# EAGLE design RAINMETER_V1 (EAGLE 9.6.2)
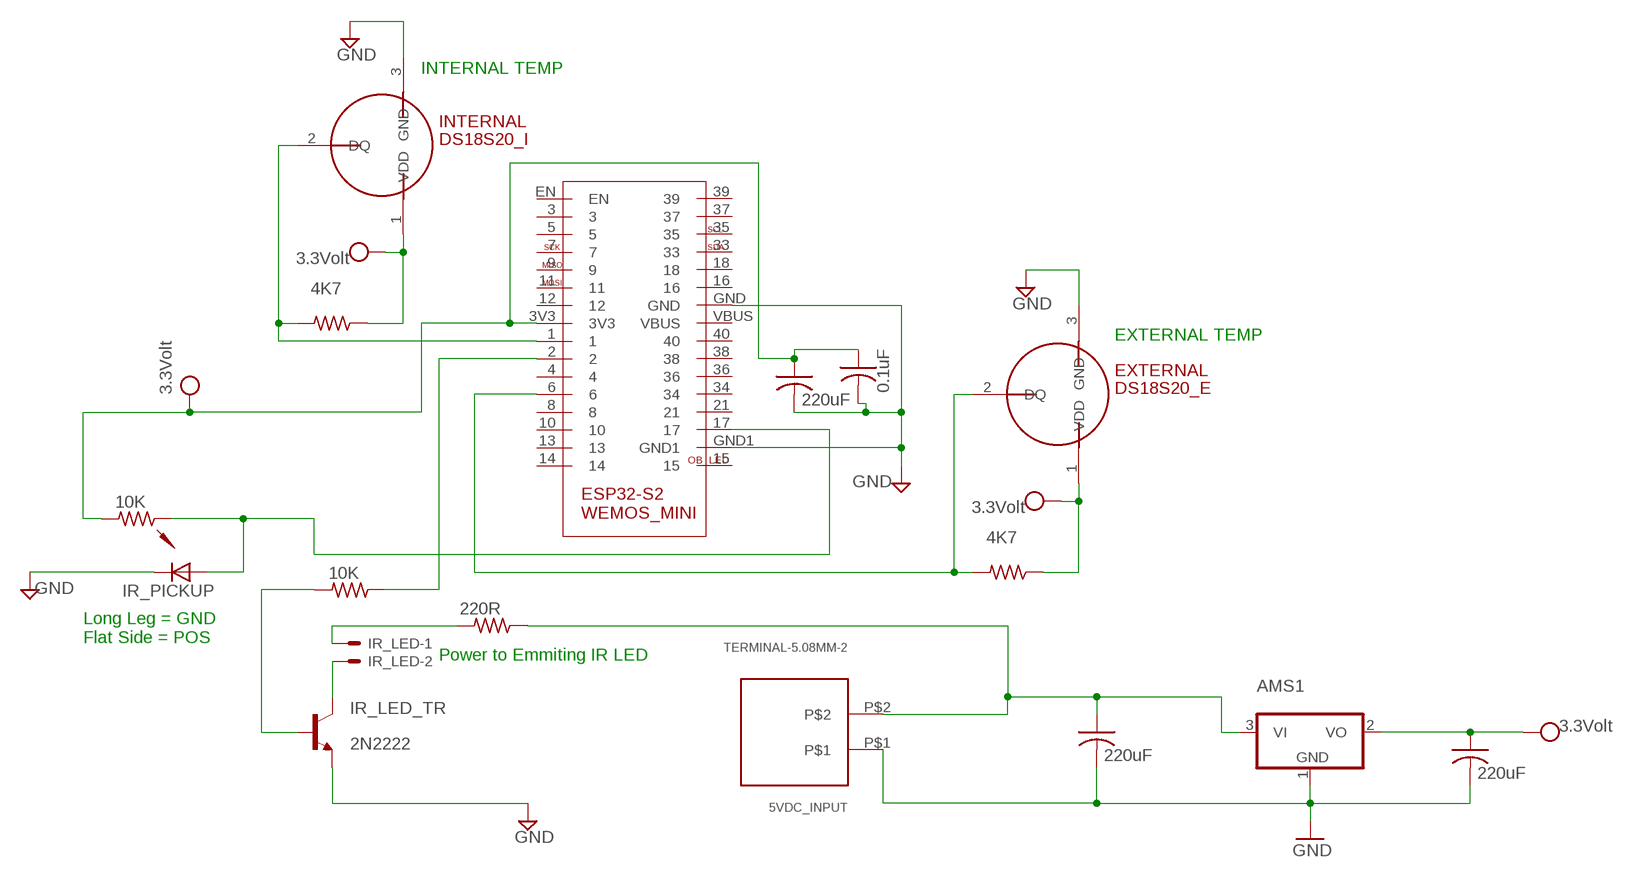
[diagram p0: schematic, sheet 1]

## Parts
5VDC_INPUT  TERMINAL-5.08MM-2  [TERM-5.05-2]
AMS1  AMS1117DB  [SOT223]
C1  220uF  CAP_3.5MMCAP2.5/5  [C3.5-5]
C2  220uF  CAP_3.5MMCAP2.5/5  [C3.5-5]
C5  0.1uF  C-US050-025X075  [C050-025X075]
C7  220uF  CAP_3.5MMCAP2.5/5  [C3.5-5]
DS18S20_E  EXTERNAL  DS1820  [TO92-LINE]
DS18S20_I  INTERNAL  DS1820  [TO92-LINE]
IR_LED  C-GRID-02-70553  [70553-02]
IR_LED_TR  2N2222  [TO92-EBC-OVAL]
IR_PICKUP  INFRARED_PICKUP5MM  [INFRARED_PICKUP]
R1  4K7  R-US_R0805  [R0805]
R2  10K  R-US_R0805  [R0805]
R3  4K7  R-US_R0805  [R0805]
R7  220R  R-US_R0805  [R0805]
R8  10K  R-US_R0805  [R0805]
U$2  WEMOS_S2_MINI  [WEMOS_S2_MINI]

## Nets
GND [GND]: 5VDC_INPUT.P$1 AMS1.1(GND) C1.2 C2.2 C5.2 C7.2 DS18S20_E.3(GND) DS18S20_I.3(GND) IR_LED_TR.E IR_PICKUP.K(C) U$2.GND U$2.GND1
N$1: DS18S20_I.2(DQ) R1.2 U$2.1
N$2: IR_LED.2 IR_LED_TR.C
N$3: DS18S20_E.2(DQ) R3.2 U$2.6
N$4 [GND]: IR_LED.1 R7.2
N$5: IR_LED_TR.B R2.2
N$6: R2.1 U$2.2
N$18: IR_PICKUP.A R8.1 U$2.17
N$21 [12V]: 5VDC_INPUT.P$2 AMS1.3(VI) C7.1 R7.1
VCC [3V]: AMS1.2(VO) C1.1 C2.1 C5.1 DS18S20_E.1(VDD) DS18S20_I.1(VDD) R1.1 R3.1 R8.2 U$2.3V3
Unconnected: U$2.3 U$2.4 U$2.5 U$2.7 U$2.8 U$2.9 U$2.10 U$2.11 U$2.12 U$2.13 U$2.14 U$2.15 U$2.16 U$2.18 U$2.21 U$2.33 U$2.34 U$2.35 U$2.36 U$2.37 U$2.38 U$2.39 U$2.40 U$2.EN U$2.VBUS

## Notes on the sheet
- INTERNAL TEMP
- EXTERNAL TEMP
- Long Leg = GND
  Flat Side = POS
- Power to Emmiting IR LED

## Library data of the parts
5VDC_INPUT = BDV_01:TERMINAL-5.08MM-2: Terminal 5.08mm - 2
AMS1 = BDV_01:AMS1117: 250 mA, 16V, Low Quiescent Current LDO Regulator Source: http://ww1.microchip.com/downloads/en/DeviceDoc/22049b.pdf
C1 C2 C7 = BDV_01:CAP_3.5MM: Cap 3.5 MM
C5 = adafruit:C-US: CAPACITOR, American symbol
DS18S20_E DS18S20_I = BDV_01:DS1820: DS1820 (Temperature Sensor)
IR_LED = con-molex:C-GRID-02: CONNECTOR wire to board 2.54 mm (0.100") pitch header; OC_FARNELL: unknown; OC_NEWARK: unknown
IR_LED_TR = adafruit:2N2222: NPN TRANSISTOR Big oval pads
IR_PICKUP = BDV_01:INFRARED_PICKUP: Infra Red LED Pickup
R1-R3 R7 R8 = resistor:R-US_: RESISTOR, American symbol
U$2 = BDV_02:WEMOS_S2_MINI: WEMOS_MINI

## Net classes
0 default: width 0.8 mm, drill 0.508 mm, clearance 0.6 mm
1 POWER: width 0.8 mm, drill 0.508 mm, clearance 0.6 mm
2 12V: width 0.8 mm, drill 0.508 mm, clearance 0.6 mm
3 5V: width 0.8 mm, drill 0.508 mm, clearance 0.6 mm
4 3V: width 0.8 mm, drill 0.508 mm, clearance 0.6 mm
5 GND: width 0.8 mm, drill 0.508 mm, clearance 0.6 mm

## Board
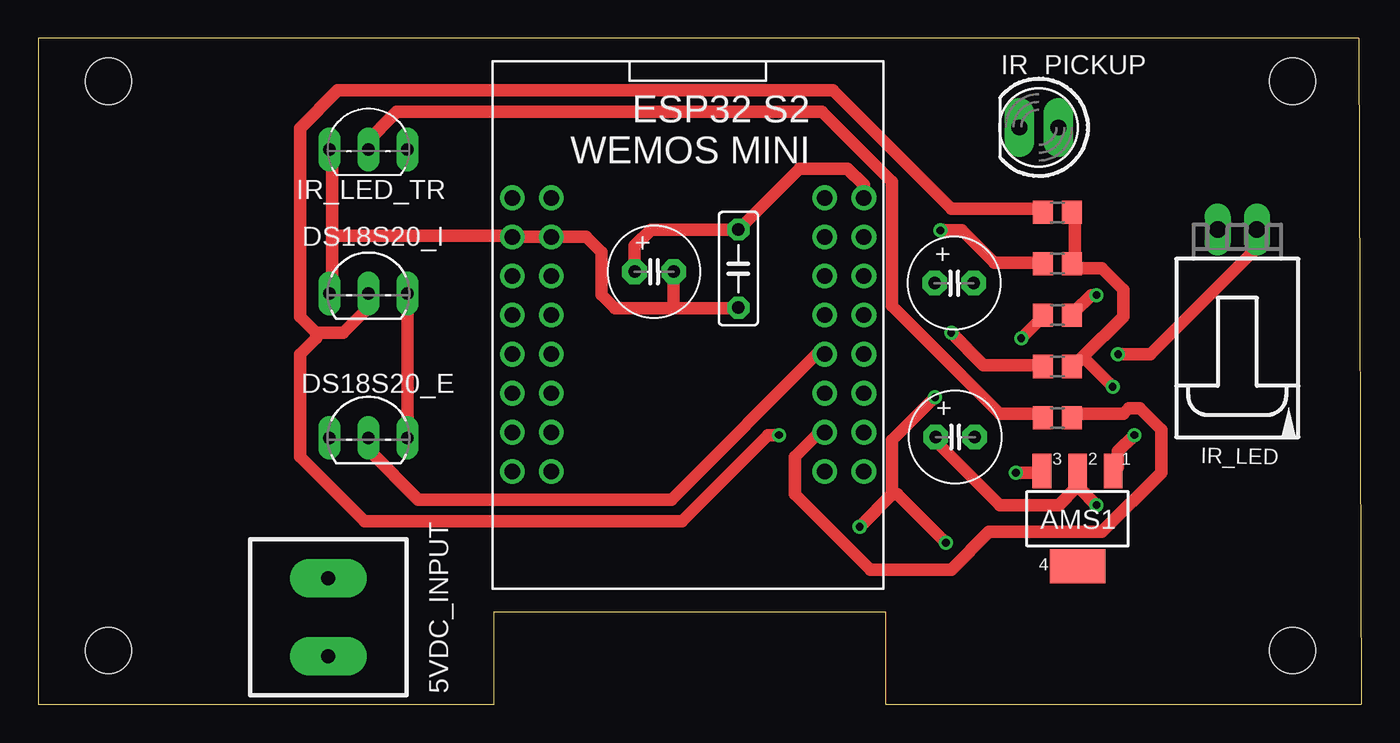
[diagram p1: board, top side]
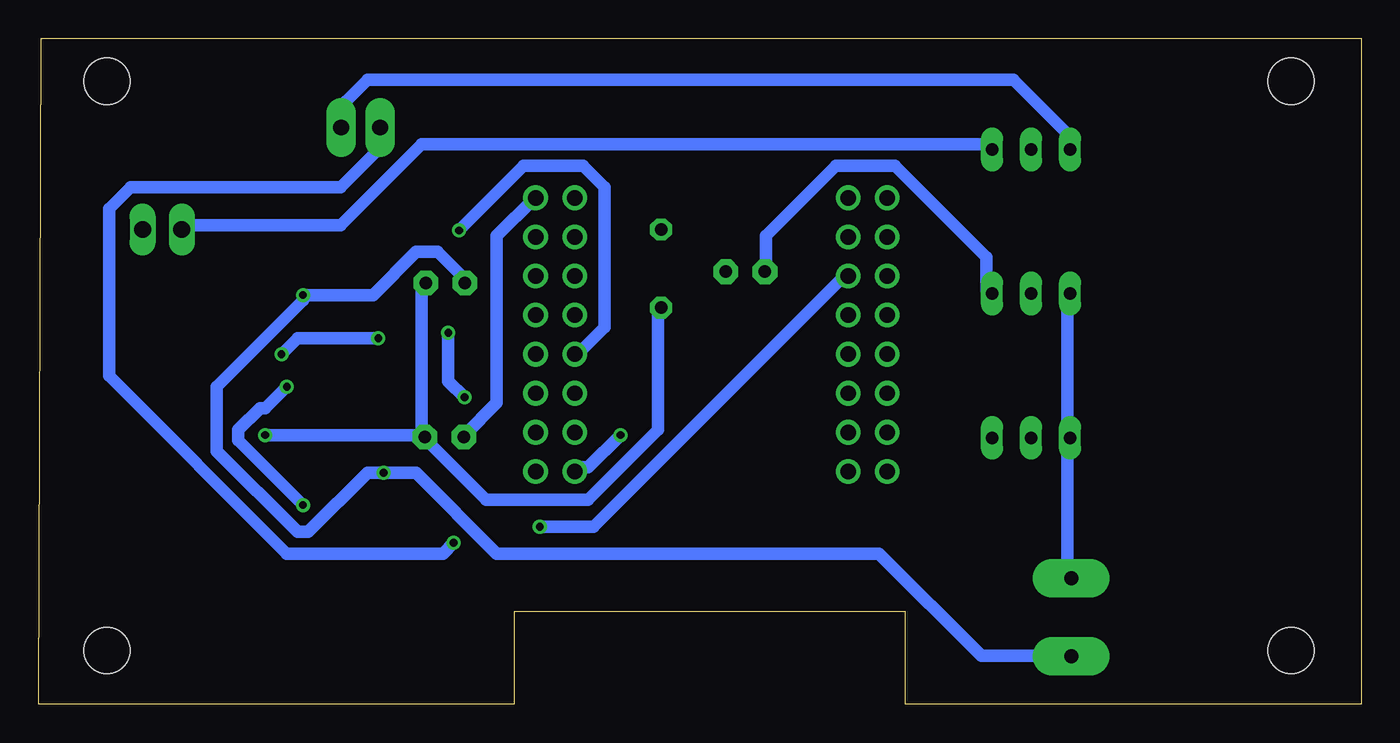
[diagram p2: board, bottom side, seen from below]

Size 86 x 43.28 mm. Coordinates in mm from the lower left corner, seen from the top.
Outline: 85.85,43.28 0,43.28 0,0 29.64,0 29.64,6 55.07,6 55.07,0 86,0 85.85,43.28
Copper layers (1*16): Top 0.035mm / dielectric 1.5mm / Bottom 0.035mm
Design rules "default_BDV_04 *": minimum track width 6mil, minimum drill 0.35mm, track to track 6mil, track to pad 6mil, pad to pad 6mil, via to via 6mil, smd to smd 6mil, copper to edge 40mil, drill to drill 6mil, minimum pad ring 12mil, minimum via ring 8mil, stop-mask expansion 4mil, vias tented up to drill 20mil, thermal gap 16mil
Holes 3 mm at 4.55,3.5 4.55,40.5 81.55,40.5 81.55,3.5

### Footprints (pad centres in the part's own frame; a part is rotated, then mirrored left to right if it is on the bottom)
TERM-5.05-2 = drill 0.9 pad 2.5 long: P$1 0,2.54; P$2 0,-2.54
SOT223 = smd 1.219 x 2.235: 1 -2.311,-3.099; 2 0,-3.099; 3 2.311,-3.099 | smd 3.6 x 2.2: 4 0,3.099
C3.5-5 = drill 0.813 pad 1.6 octagon: 1 -1.27,0; 2 1.27,0
C050-025X075 = drill 0.813 octagon: 1 -2.54,0; 2 2.54,0
TO92-LINE = drill 0.813 long: 1 2.54,0; 2 0,0; 3 -2.54,0
70553-02 = drill 1.092 long: 1 -1.27,-7.62; 2 1.27,-7.62
TO92-EBC-OVAL = drill 0.813 long: B 0,-1.27; C 2.54,-1.27; E -2.54,-1.27
INFRARED_PICKUP = drill 1.016 pad 1.93 long: A 1.27,0; K -1.27,0
R0805 = smd 1.3 x 1.5: 1 -0.95,0; 2 0.95,0
WEMOS_S2_MINI = drill 1: 1 -8.89,10.16; 2 -8.89,7.62; 3 -11.43,7.62; 3V3 -11.43,-7.62; 4 -8.89,5.08; 5 -11.43,5.08; 6 -8.89,2.54; 7 -11.43,2.54; 8 -8.89,0; 9 -11.43,0; 10 -8.89,-2.54; 11 -11.43,-2.54; 12 -11.43,-5.08; 13 -8.89,-5.08; 14 -8.89,-7.62; 15 8.89,-7.62; 16 11.43,-2.54; 17 8.89,-2.54; 18 11.43,0; 21 8.89,0; 33 11.43,2.54; 34 8.89,2.54; 35 11.43,5.08; 36 8.89,5.08; 37 11.43,7.62; 38 8.89,7.62; 39 11.43,10.16; 40 8.89,10.16; EN -11.43,10.16; GND 11.43,-5.08; GND1 8.89,-5.08; VBUS 11.43,-7.62

### Placement (x,y rotation side)
5VDC_INPUT  18.85,5.66 0 top
AMS1  67.56,12.06 180 top
C1  59.61,17.37 0 top
C2  40.03,28.12 0 top
C5  45.52,28.32 270 top
C7  59.54,27.38 0 top
DS18S20_E  21.46,17.32 0 top
DS18S20_I  21.46,26.7 0 top
IR_LED  77.95,23.24 180 top
IR_LED_TR  21.46,37.34 0 top
IR_PICKUP  65.05,37.5 180 top
R1  66.25,31.98 180 top
R2  66.25,18.61 180 top
R3  66.25,28.64 180 top
R7  66.25,25.3 180 top
R8  66.25,21.96 0 top
U$2  42.24,25.3 180 top

### Tracks (layer width: path | path; a pad name or v marks a point on that pad's centre or on a via)
GND  (via drill 0.51)
  Top 0.8: 41.27,25.73 45.46,25.73 C5.2 | 41.27,25.73 37.49,25.73 36.6,26.62 36.6,29.39 35.61,30.38 U$2.GND1 U$2.GND 30.65,30.45 19.1,30.45 | C2.2 41.3,25.76 41.27,25.73 | v71.25,17.5 70.2,16.45 70.2,15.4 AMS1.1 | 19.1,30.45 19.1,36.05 IR_LED_TR.E | 19.1,30.45 19.1,26.95 DS18S20_I.3
  Bottom 0.8: v71.25,17.5 61.1,17.5 C1.2 | C7.2 61.1,27.3 61.1,17.85 C1.2 | 5VDC_INPUT.P$1 19.1,8.4 19.1,17.15 DS18S20_E.3 19.1,17.5 19.1,26.6 DS18S20_I.3 | IR_PICKUP.K 66,37.8 66,39.2 64.6,40.6 22.6,40.6 19.1,37.1 19.1,36.4 IR_LED_TR.E | C1.2 60.75,17.15 56.9,13.3 50.25,13.3 45.7,17.85 45.7,25.55 C5.2
N$1  (via drill 0.51)
  Top 0.8: 18.05,24.15 17,25.2 17,37.45 19.45,39.9 51.65,39.9 59.35,32.2 65.3,32.2 R1.2 | 18.05,24.15 19.8,24.15 21.2,25.55 21.2,26.6 DS18S20_I.2 | v48.15,17.5 47.45,17.5 41.85,11.9 21.2,11.9 17,16.1 17,22.75 18.05,23.8 18.05,24.15
  Bottom 0.8: v48.15,17.5 50.25,15.4 50.95,15.4 U$2.1
N$2
  Bottom 0.8: IR_LED_TR.C 24.35,36.4 61.1,36.4 66.35,31.15 76.5,31.15 IR_LED.2
N$3  (via drill 0.51)
  Top 0.8: v58.65,30.8 60.05,30.8 62.15,28.7 65.3,28.7 R3.2 | DS18S20_E.2 21.55,17.15 21.55,16.45 24.7,13.3 41.15,13.3 50.95,23.1 U$2.6
  Bottom 0.8: v58.65,30.8 54.45,35 50.6,35 49.2,33.6 49.2,24.5 50.95,22.75 U$2.6
N$4  (via drill 0.51)
  Top 0.8: v63.9,23.8 65.3,25.2 R7.2 | v70.2,22.75 72.3,22.75 78.95,29.4 78.95,30.8 IR_LED.1
  Bottom 0.8: v63.9,23.8 69.15,23.8 v70.2,22.75
N$5
  Top 0.8: R2.2 65.3,18.9 62.5,18.9 55.5,25.9 55.5,33.95 50.95,38.5 23.3,38.5 21.2,36.4 IR_LED_TR.B
N$6
  Top 0.8: R2.1 67.4,18.9 70.55,18.9 70.9,19.25 71.6,19.25 73,17.85 73,15.05 69.15,11.2 61.8,11.2 59.35,8.75 54.1,8.75 49.2,13.65 49.2,16.1 50.95,17.85 U$2.2
N$18  (via drill 0.51)
  Top 0.8: v59.35,24.15 61.45,22.05 65.3,22.05 R8.1 | v58.3,19.95 55.5,17.15 55.5,13.65 | v53.4,11.55 55.5,13.65 | v59,10.5 55.85,13.65 55.5,13.65
  Bottom 0.8: v59.35,24.15 59.35,21 v58.3,19.95 | v53.4,11.55 49.9,11.55 33.45,28 U$2.17 | v59,10.5 59.7,9.8 69.85,9.8 81.4,21.35 81.4,32.2 80,33.6 66.35,33.6 63.9,36.05 63.9,37.45 IR_PICKUP.A
N$21  (via drill 0.51)
  Top 0.8: v68.8,26.6 68.45,26.6 67.4,25.55 R7.1 | v63.55,15.05 64.95,15.05 AMS1.3
  Bottom 0.8: C7.1 58.3,27.65 60.05,29.4 61.45,29.4 64.25,26.6 v68.8,26.6 68.8,26.25 74.4,20.65 74.4,16.45 69.15,11.2 68.45,11.2 64.6,15.05 v63.55,15.05 61.45,15.05 56.2,9.8 31.35,9.8 24.7,3.15 19.1,3.15 5VDC_INPUT.P$2
VCC  (via drill 0.51)
  Top 0.8: C2.1 38.76,29.79 39.83,30.86 C5.1 49.48,34.82 52.6,34.82 53.67,33.76 U$2.3V3 | DS18S20_E.1 24,17.5 24,26.6 DS18S20_I.1 | 67.92,22.57 70.55,25.2 70.55,26.95 69.15,28.35 67.4,28.35 R3.1 67.4,28.7 67.4,31.85 R1.1 | 67.92,22.57 67.4,22.05 R8.2 | 67.4,14 67.4,15.05 AMS1.2 | 67.4,14 66.35,12.95 62.5,12.95 58.3,17.15 C1.1 | v69.85,20.65 67.92,22.57 | v68.8,12.95 67.75,14 67.4,14
  Bottom 0.8: DS18S20_I.1 24.35,26.95 24.35,29.05 30.3,35 34.15,35 38.7,30.45 38.7,28.35 C2.1 | v69.85,20.65 71.25,19.25 71.6,19.25 73,17.85 73,17.15 v68.8,12.95 | U$2.3V3 53.75,32.9 56.2,30.45 56.2,19.6 58.3,17.5 C1.1

### Text on the board
tValues: - | - | + | RAIN GAUGE 01-10-2026 | +